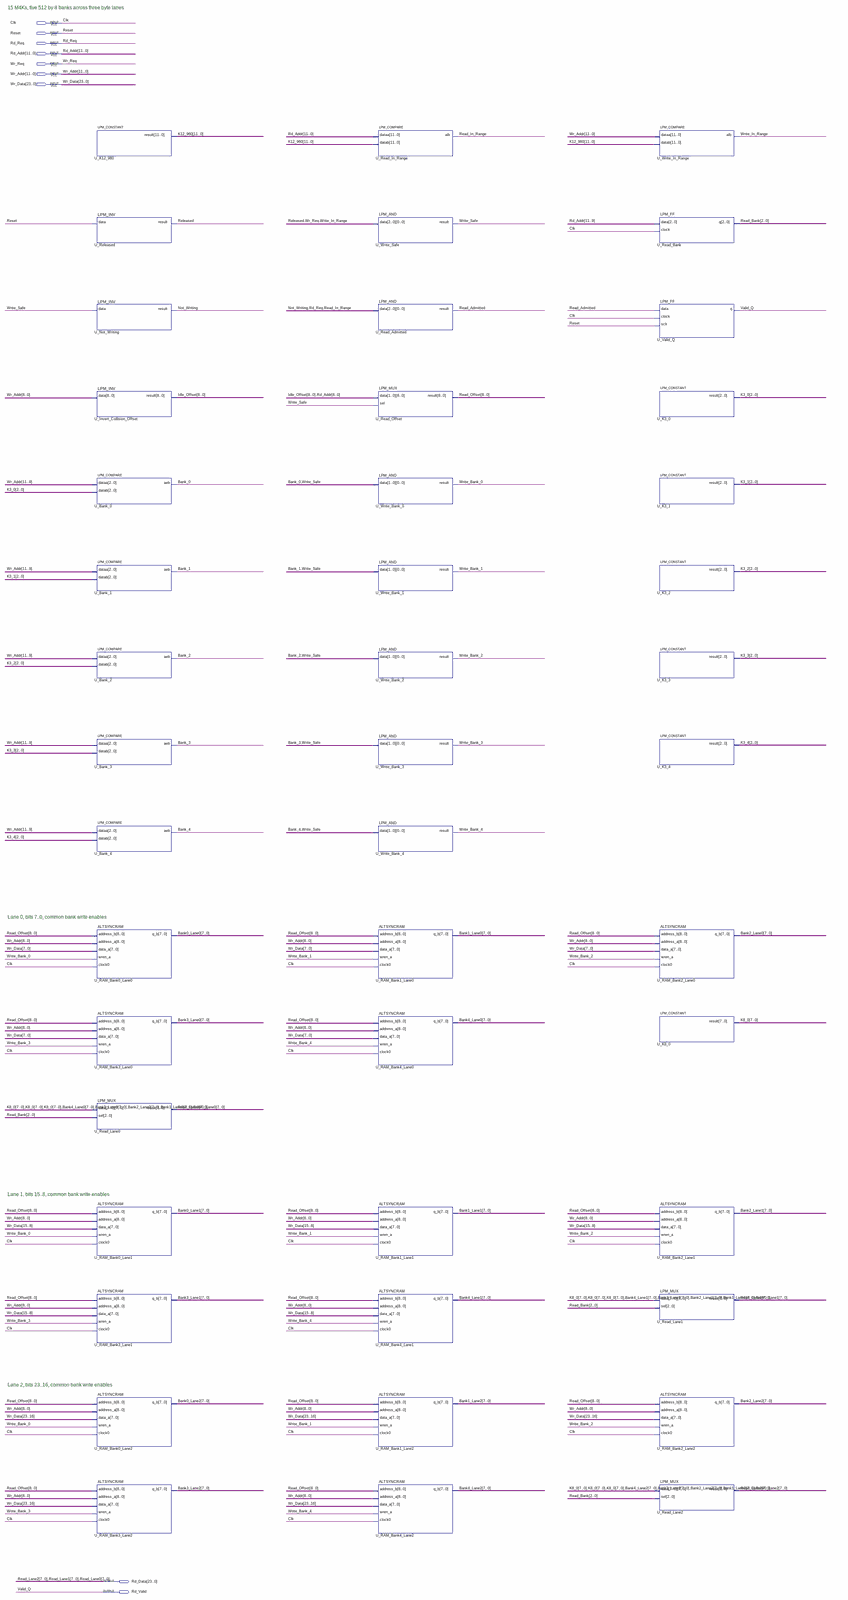
[diagram p0: schematic sheet, whole]
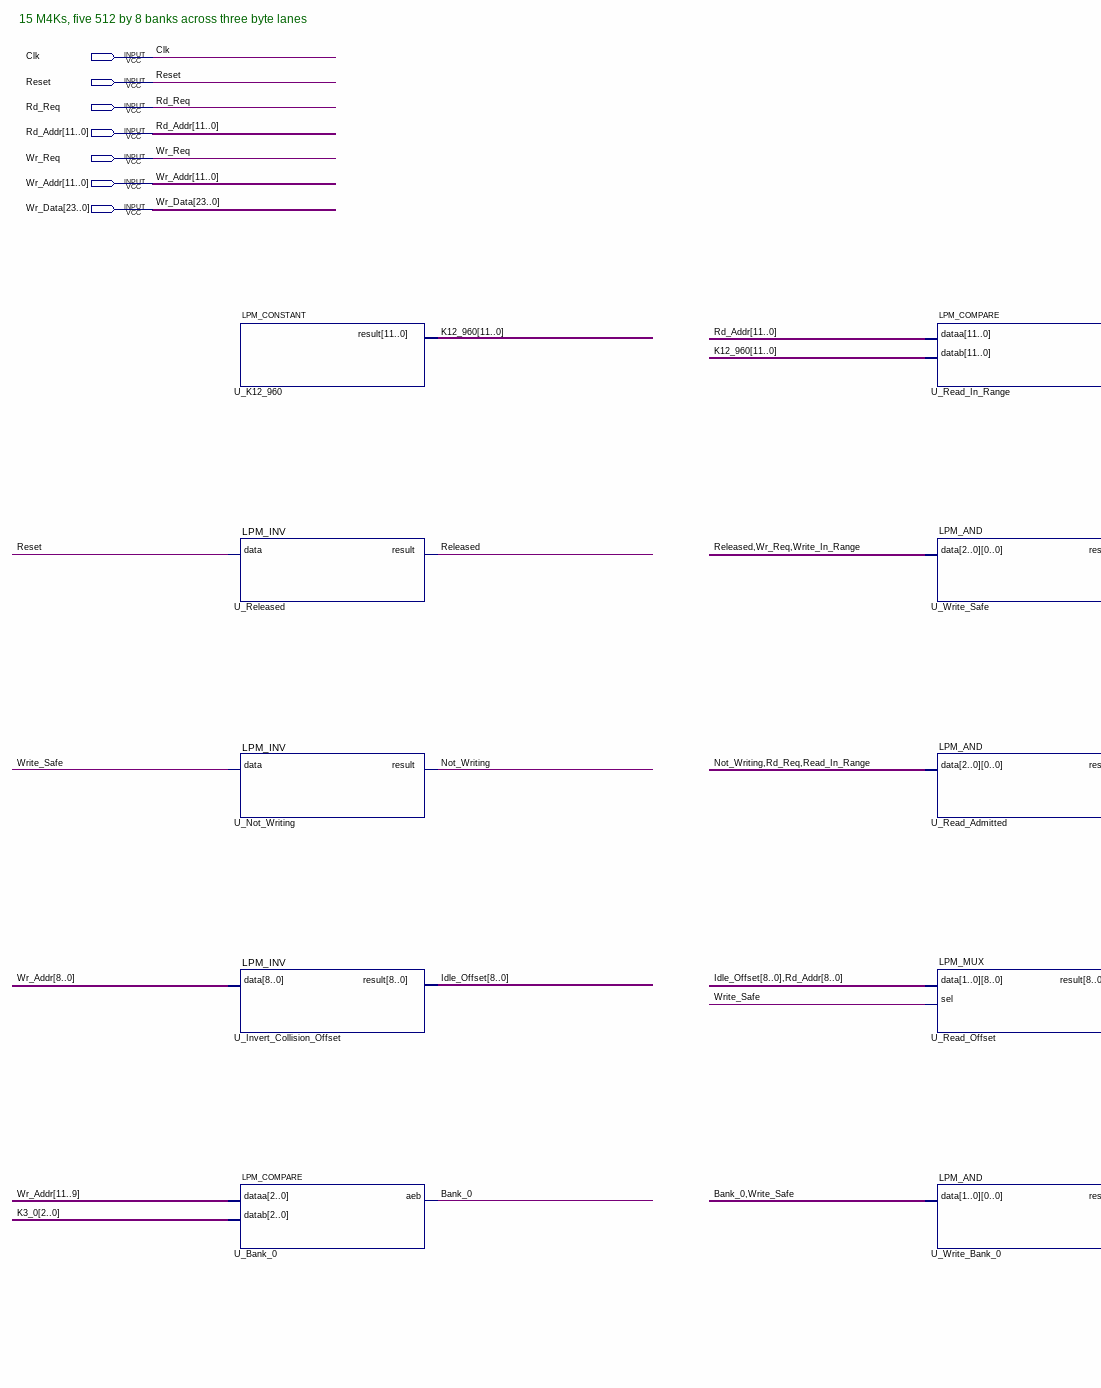
[diagram p1: schematic sheet, upper left part]
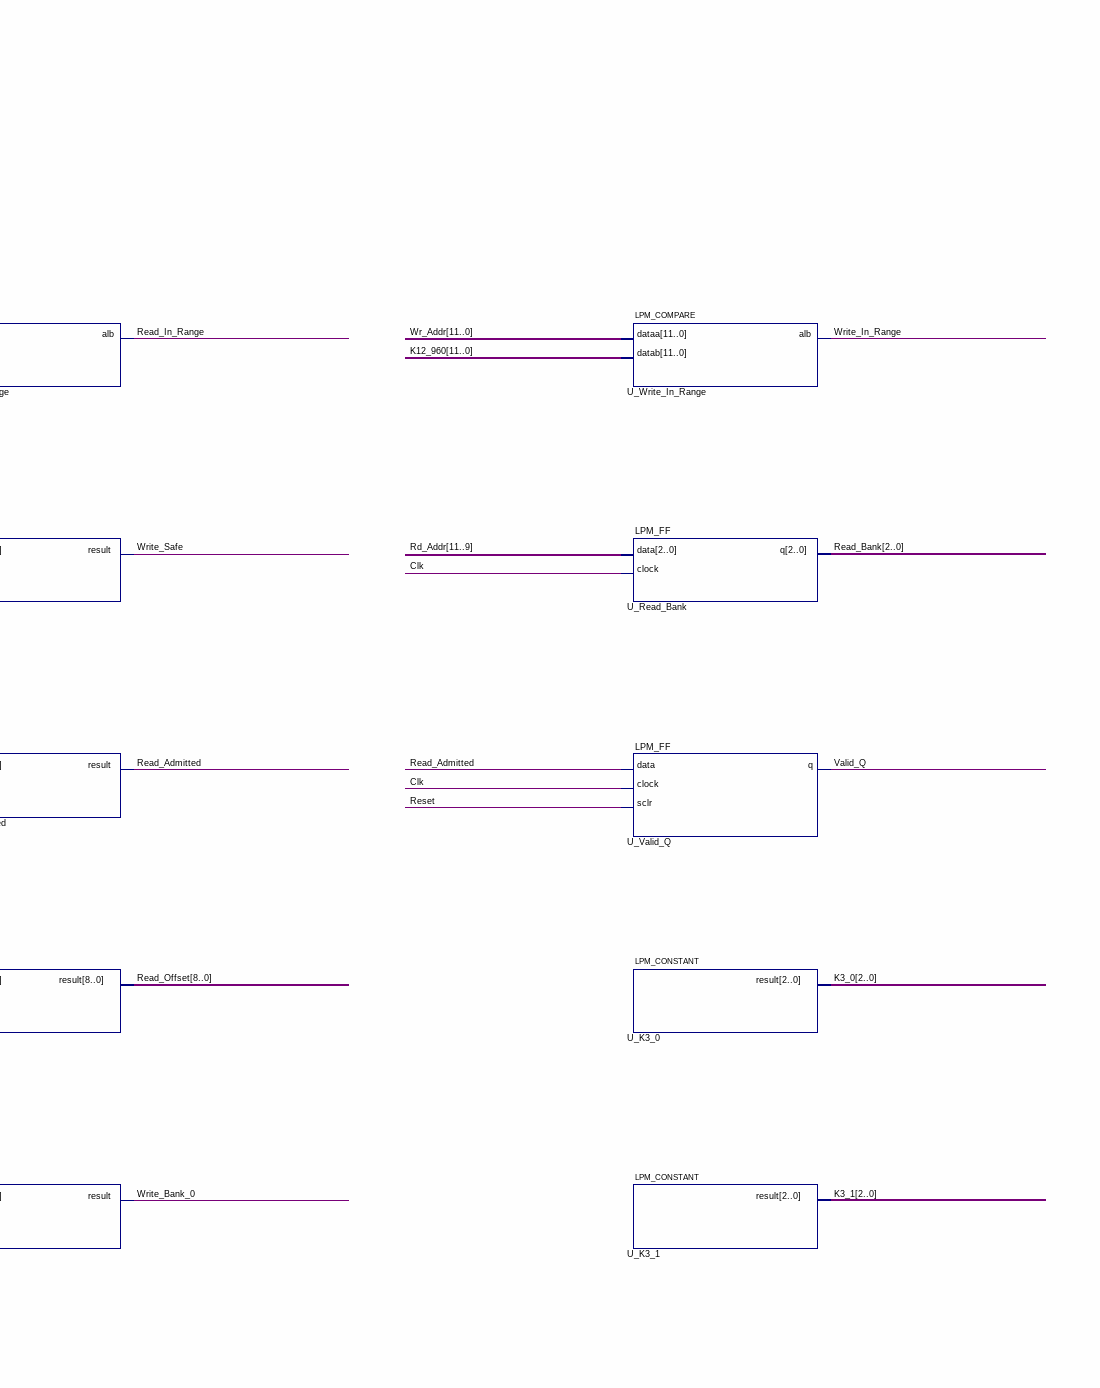
[diagram p2: schematic sheet, upper right part]
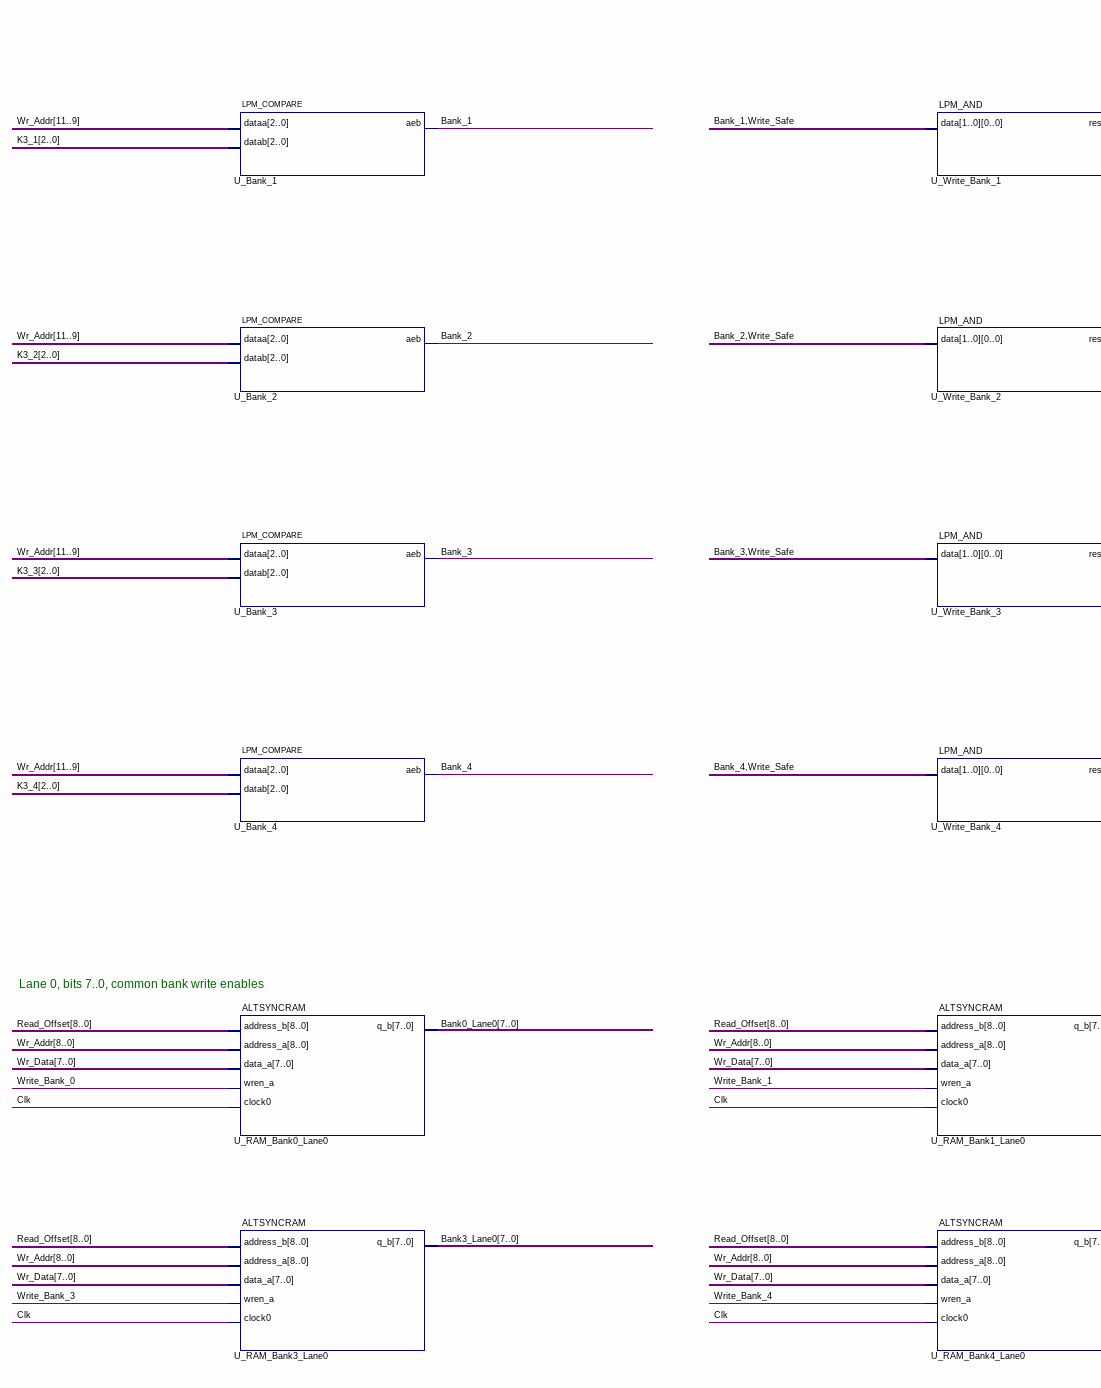
[diagram p3: schematic sheet, middle left part]
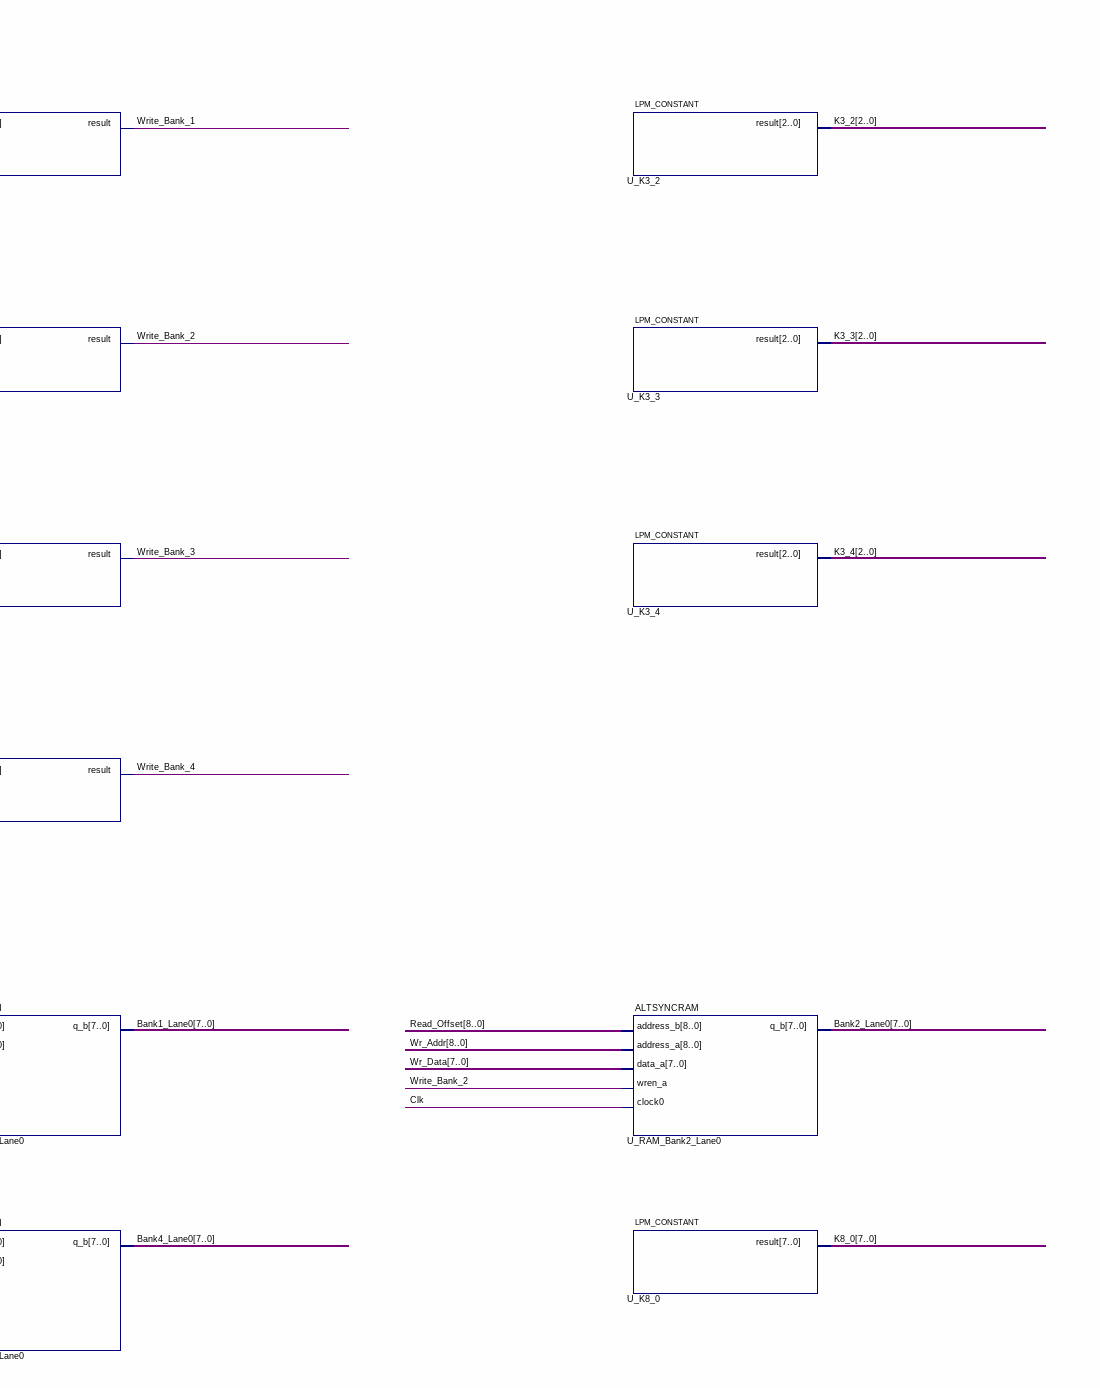
[diagram p4: schematic sheet, middle right part]
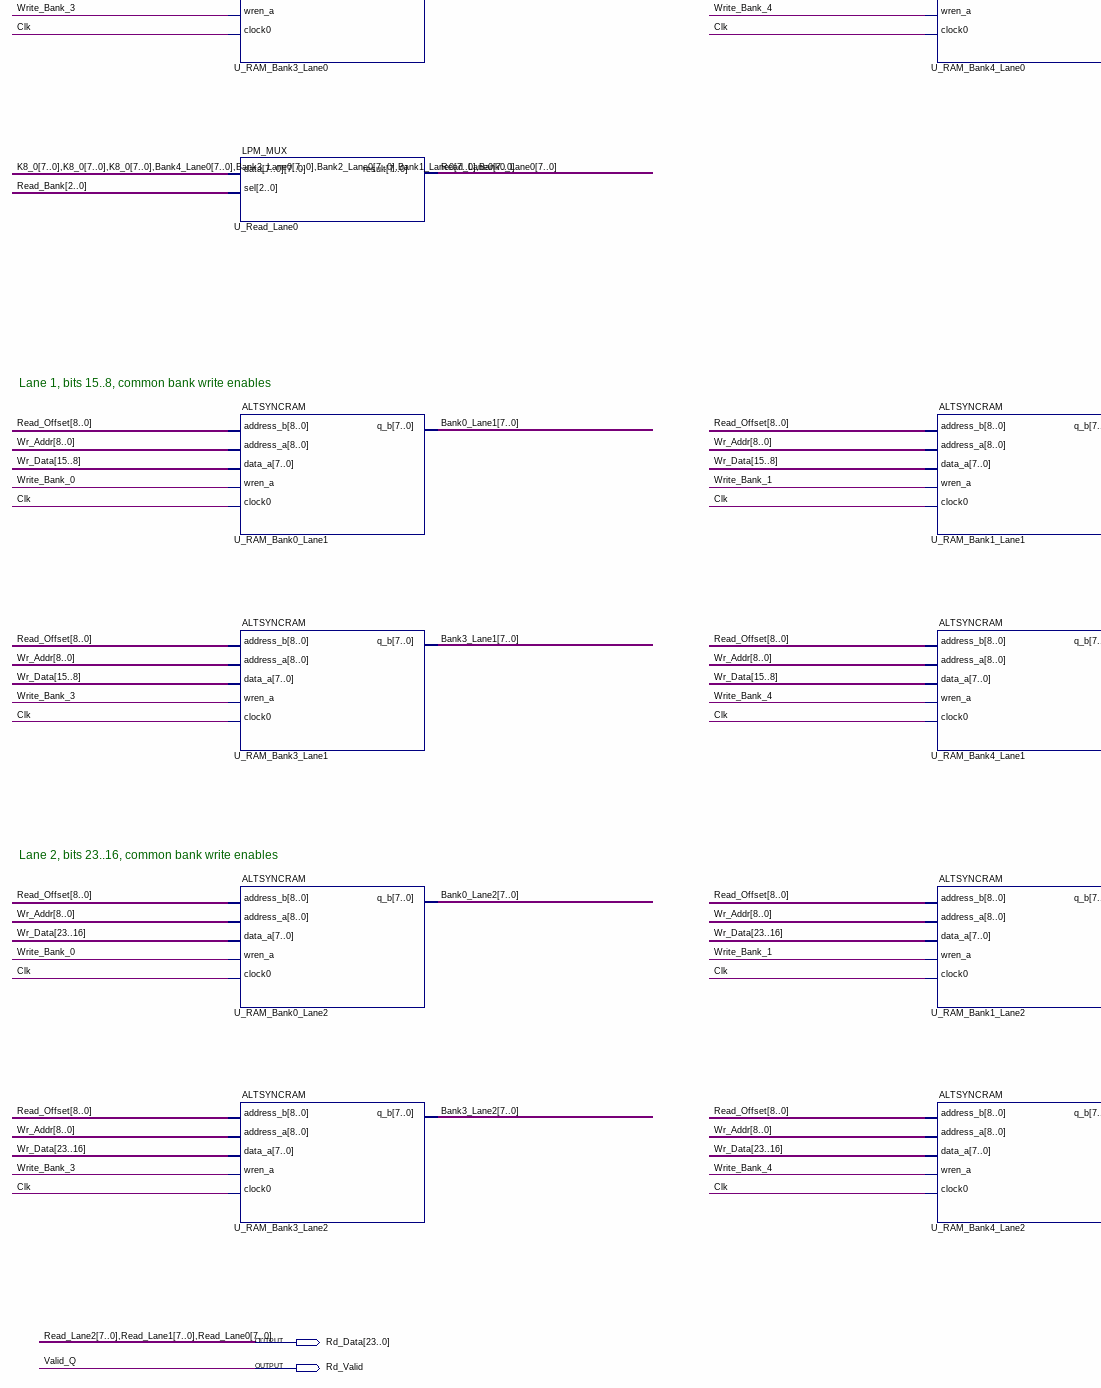
[diagram p5: schematic sheet, lower left part]
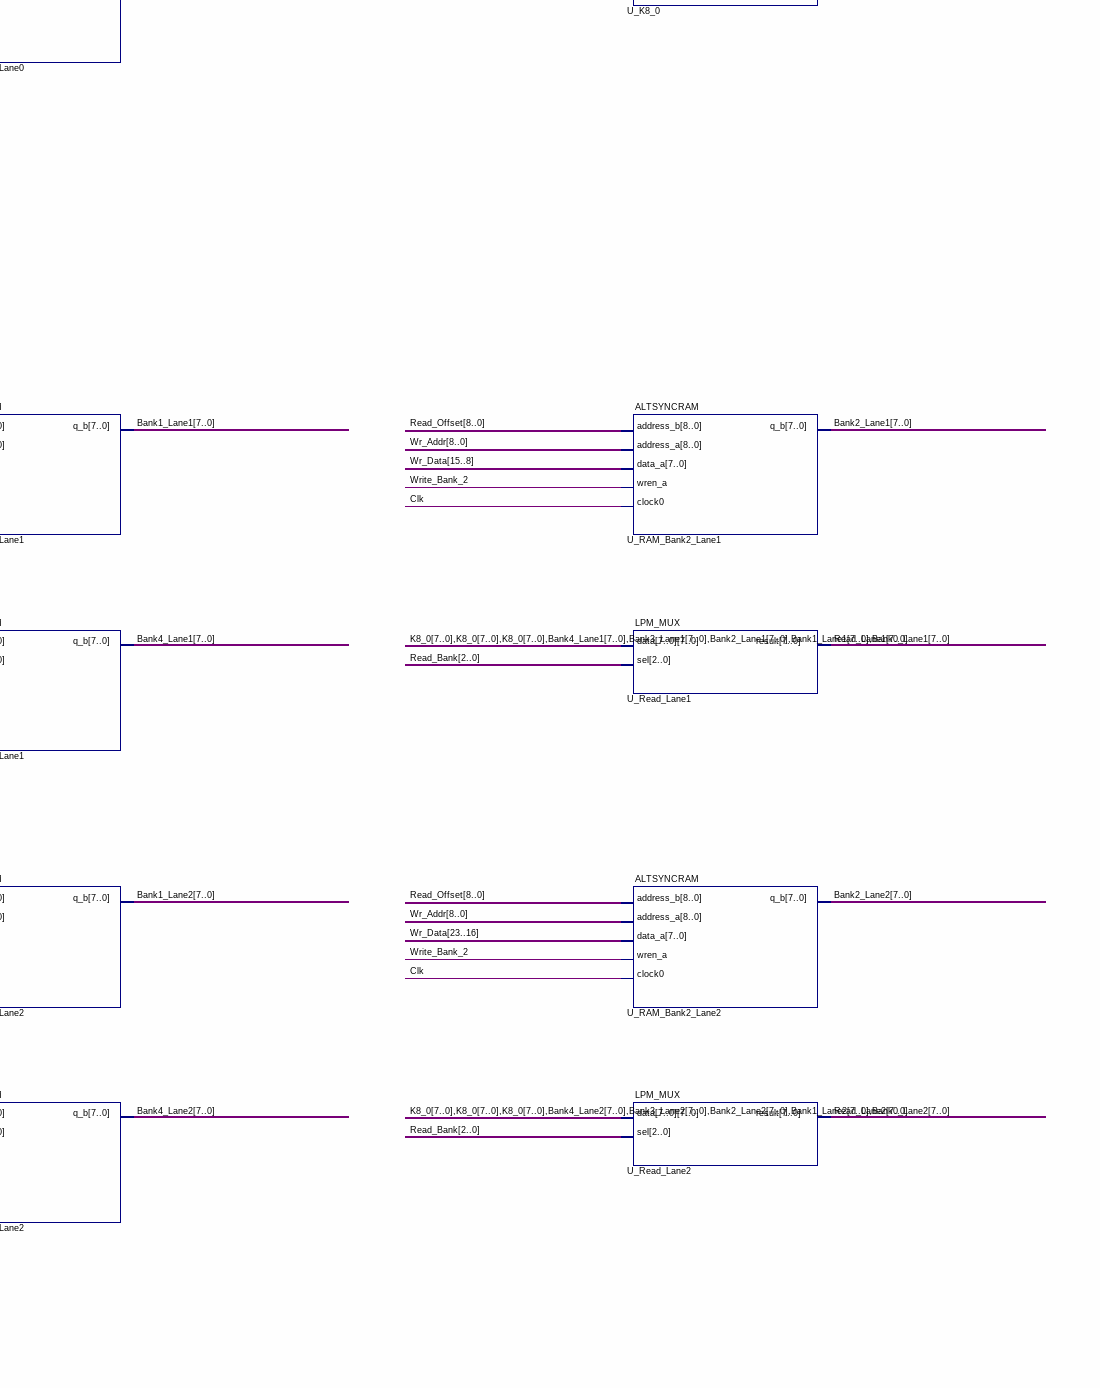
[diagram p6: schematic sheet, lower right part]
// Quartus schematic Screen_Store.bdf as structural Verilog: 45 symbols, 9 pins
module Screen_Store (
  input  Clk,
  input  Reset,
  input  Rd_Req,
  input  [11:0] Rd_Addr,
  input  Wr_Req,
  input  [11:0] Wr_Addr,
  input  [23:0] Wr_Data,
  output [23:0] Rd_Data,
  output Rd_Valid
);

  wire Bank_0, Bank_1, Bank_2, Bank_3, Bank_4, Not_Writing, Read_Admitted, Read_In_Range, Released,
       Write_Bank_0, Write_Bank_1, Write_Bank_2, Write_Bank_3, Write_Bank_4, Write_In_Range, Write_Safe;
  wire [2:0] K3_0, K3_1, K3_2, K3_3, K3_4, Read_Bank;
  wire [7:0] Bank0_Lane0, Bank0_Lane1, Bank0_Lane2, Bank1_Lane0, Bank1_Lane1, Bank1_Lane2, Bank2_Lane0,
       Bank2_Lane1, Bank2_Lane2, Bank3_Lane0, Bank3_Lane1, Bank3_Lane2, Bank4_Lane0, Bank4_Lane1,
       Bank4_Lane2, K8_0;
  wire [8:0] Idle_Offset, Read_Offset;
  wire [11:0] K12_960;

  LPM_CONSTANT #(.LPM_WIDTH(12), .LPM_CVALUE(2400)) U_K12_960 (.result(K12_960));
  LPM_INV #(.LPM_WIDTH(1)) U_Released (.data(Reset), .result(Released));
  LPM_INV #(.LPM_WIDTH(1)) U_Not_Writing (.data(Write_Safe), .result(Not_Writing));
  LPM_INV #(.LPM_WIDTH(9)) U_Invert_Collision_Offset (.data(Wr_Addr[8:0]), .result(Idle_Offset));
  LPM_COMPARE #(.LPM_WIDTH(3), .LPM_REPRESENTATION("UNSIGNED")) U_Bank_0 (
    .dataa(Wr_Addr[11:9]), .datab(K3_0), .aeb(Bank_0));
  LPM_COMPARE #(.LPM_WIDTH(3), .LPM_REPRESENTATION("UNSIGNED")) U_Bank_1 (
    .dataa(Wr_Addr[11:9]), .datab(K3_1), .aeb(Bank_1));
  LPM_COMPARE #(.LPM_WIDTH(3), .LPM_REPRESENTATION("UNSIGNED")) U_Bank_2 (
    .dataa(Wr_Addr[11:9]), .datab(K3_2), .aeb(Bank_2));
  LPM_COMPARE #(.LPM_WIDTH(3), .LPM_REPRESENTATION("UNSIGNED")) U_Bank_3 (
    .dataa(Wr_Addr[11:9]), .datab(K3_3), .aeb(Bank_3));
  LPM_COMPARE #(.LPM_WIDTH(3), .LPM_REPRESENTATION("UNSIGNED")) U_Bank_4 (
    .dataa(Wr_Addr[11:9]), .datab(K3_4), .aeb(Bank_4));
  ALTSYNCRAM #(.OPERATION_MODE("DUAL_PORT"), .RAM_BLOCK_TYPE("M4K"), .WIDTH_A(8), .WIDTH_B(8), .WIDTHAD_A(9), .WIDTHAD_B(9), .NUMWORDS_A(512), .NUMWORDS_B(512), .ADDRESS_REG_B("CLOCK0"), .OUTDATA_REG_B("UNREGISTERED"), .READ_DURING_WRITE_MODE_MIXED_PORTS("DONT_CARE")) U_RAM_Bank0_Lane0 (
    .address_b(Read_Offset), .address_a(Wr_Addr[8:0]), .data_a(Wr_Data[7:0]), .wren_a(Write_Bank_0),
    .clock0(Clk), .q_b(Bank0_Lane0));
  ALTSYNCRAM #(.OPERATION_MODE("DUAL_PORT"), .RAM_BLOCK_TYPE("M4K"), .WIDTH_A(8), .WIDTH_B(8), .WIDTHAD_A(9), .WIDTHAD_B(9), .NUMWORDS_A(512), .NUMWORDS_B(512), .ADDRESS_REG_B("CLOCK0"), .OUTDATA_REG_B("UNREGISTERED"), .READ_DURING_WRITE_MODE_MIXED_PORTS("DONT_CARE")) U_RAM_Bank3_Lane0 (
    .address_b(Read_Offset), .address_a(Wr_Addr[8:0]), .data_a(Wr_Data[7:0]), .wren_a(Write_Bank_3),
    .clock0(Clk), .q_b(Bank3_Lane0));
  LPM_MUX #(.LPM_WIDTH(8), .LPM_SIZE(8), .LPM_WIDTHS(3)) U_Read_Lane0 (
    .data({K8_0, K8_0, K8_0, Bank4_Lane0, Bank3_Lane0, Bank2_Lane0, Bank1_Lane0, Bank0_Lane0}),
    .sel(Read_Bank), .result(Rd_Data[7:0]));
  ALTSYNCRAM #(.OPERATION_MODE("DUAL_PORT"), .RAM_BLOCK_TYPE("M4K"), .WIDTH_A(8), .WIDTH_B(8), .WIDTHAD_A(9), .WIDTHAD_B(9), .NUMWORDS_A(512), .NUMWORDS_B(512), .ADDRESS_REG_B("CLOCK0"), .OUTDATA_REG_B("UNREGISTERED"), .READ_DURING_WRITE_MODE_MIXED_PORTS("DONT_CARE")) U_RAM_Bank0_Lane1 (
    .address_b(Read_Offset), .address_a(Wr_Addr[8:0]), .data_a(Wr_Data[15:8]), .wren_a(Write_Bank_0),
    .clock0(Clk), .q_b(Bank0_Lane1));
  ALTSYNCRAM #(.OPERATION_MODE("DUAL_PORT"), .RAM_BLOCK_TYPE("M4K"), .WIDTH_A(8), .WIDTH_B(8), .WIDTHAD_A(9), .WIDTHAD_B(9), .NUMWORDS_A(512), .NUMWORDS_B(512), .ADDRESS_REG_B("CLOCK0"), .OUTDATA_REG_B("UNREGISTERED"), .READ_DURING_WRITE_MODE_MIXED_PORTS("DONT_CARE")) U_RAM_Bank3_Lane1 (
    .address_b(Read_Offset), .address_a(Wr_Addr[8:0]), .data_a(Wr_Data[15:8]), .wren_a(Write_Bank_3),
    .clock0(Clk), .q_b(Bank3_Lane1));
  ALTSYNCRAM #(.OPERATION_MODE("DUAL_PORT"), .RAM_BLOCK_TYPE("M4K"), .WIDTH_A(8), .WIDTH_B(8), .WIDTHAD_A(9), .WIDTHAD_B(9), .NUMWORDS_A(512), .NUMWORDS_B(512), .ADDRESS_REG_B("CLOCK0"), .OUTDATA_REG_B("UNREGISTERED"), .READ_DURING_WRITE_MODE_MIXED_PORTS("DONT_CARE")) U_RAM_Bank0_Lane2 (
    .address_b(Read_Offset), .address_a(Wr_Addr[8:0]), .data_a(Wr_Data[23:16]), .wren_a(Write_Bank_0),
    .clock0(Clk), .q_b(Bank0_Lane2));
  ALTSYNCRAM #(.OPERATION_MODE("DUAL_PORT"), .RAM_BLOCK_TYPE("M4K"), .WIDTH_A(8), .WIDTH_B(8), .WIDTHAD_A(9), .WIDTHAD_B(9), .NUMWORDS_A(512), .NUMWORDS_B(512), .ADDRESS_REG_B("CLOCK0"), .OUTDATA_REG_B("UNREGISTERED"), .READ_DURING_WRITE_MODE_MIXED_PORTS("DONT_CARE")) U_RAM_Bank3_Lane2 (
    .address_b(Read_Offset), .address_a(Wr_Addr[8:0]), .data_a(Wr_Data[23:16]), .wren_a(Write_Bank_3),
    .clock0(Clk), .q_b(Bank3_Lane2));
  LPM_COMPARE #(.LPM_WIDTH(12), .LPM_REPRESENTATION("UNSIGNED")) U_Read_In_Range (
    .dataa(Rd_Addr), .datab(K12_960), .alb(Read_In_Range));
  LPM_AND #(.LPM_WIDTH(1), .LPM_SIZE(3)) U_Write_Safe (.data({Released, Wr_Req, Write_In_Range}), .result(Write_Safe));
  LPM_AND #(.LPM_WIDTH(1), .LPM_SIZE(3)) U_Read_Admitted (
    .data({Not_Writing, Rd_Req, Read_In_Range}), .result(Read_Admitted));
  LPM_MUX #(.LPM_WIDTH(9), .LPM_SIZE(2), .LPM_WIDTHS(1)) U_Read_Offset (
    .data({Idle_Offset, Rd_Addr[8:0]}), .sel(Write_Safe), .result(Read_Offset));
  LPM_AND #(.LPM_WIDTH(1), .LPM_SIZE(2)) U_Write_Bank_0 (.data({Bank_0, Write_Safe}), .result(Write_Bank_0));
  LPM_AND #(.LPM_WIDTH(1), .LPM_SIZE(2)) U_Write_Bank_1 (.data({Bank_1, Write_Safe}), .result(Write_Bank_1));
  LPM_AND #(.LPM_WIDTH(1), .LPM_SIZE(2)) U_Write_Bank_2 (.data({Bank_2, Write_Safe}), .result(Write_Bank_2));
  LPM_AND #(.LPM_WIDTH(1), .LPM_SIZE(2)) U_Write_Bank_3 (.data({Bank_3, Write_Safe}), .result(Write_Bank_3));
  LPM_AND #(.LPM_WIDTH(1), .LPM_SIZE(2)) U_Write_Bank_4 (.data({Bank_4, Write_Safe}), .result(Write_Bank_4));
  ALTSYNCRAM #(.OPERATION_MODE("DUAL_PORT"), .RAM_BLOCK_TYPE("M4K"), .WIDTH_A(8), .WIDTH_B(8), .WIDTHAD_A(9), .WIDTHAD_B(9), .NUMWORDS_A(512), .NUMWORDS_B(512), .ADDRESS_REG_B("CLOCK0"), .OUTDATA_REG_B("UNREGISTERED"), .READ_DURING_WRITE_MODE_MIXED_PORTS("DONT_CARE")) U_RAM_Bank1_Lane0 (
    .address_b(Read_Offset), .address_a(Wr_Addr[8:0]), .data_a(Wr_Data[7:0]), .wren_a(Write_Bank_1),
    .clock0(Clk), .q_b(Bank1_Lane0));
  ALTSYNCRAM #(.OPERATION_MODE("DUAL_PORT"), .RAM_BLOCK_TYPE("M4K"), .WIDTH_A(8), .WIDTH_B(8), .WIDTHAD_A(9), .WIDTHAD_B(9), .NUMWORDS_A(512), .NUMWORDS_B(512), .ADDRESS_REG_B("CLOCK0"), .OUTDATA_REG_B("UNREGISTERED"), .READ_DURING_WRITE_MODE_MIXED_PORTS("DONT_CARE")) U_RAM_Bank4_Lane0 (
    .address_b(Read_Offset), .address_a(Wr_Addr[8:0]), .data_a(Wr_Data[7:0]), .wren_a(Write_Bank_4),
    .clock0(Clk), .q_b(Bank4_Lane0));
  ALTSYNCRAM #(.OPERATION_MODE("DUAL_PORT"), .RAM_BLOCK_TYPE("M4K"), .WIDTH_A(8), .WIDTH_B(8), .WIDTHAD_A(9), .WIDTHAD_B(9), .NUMWORDS_A(512), .NUMWORDS_B(512), .ADDRESS_REG_B("CLOCK0"), .OUTDATA_REG_B("UNREGISTERED"), .READ_DURING_WRITE_MODE_MIXED_PORTS("DONT_CARE")) U_RAM_Bank1_Lane1 (
    .address_b(Read_Offset), .address_a(Wr_Addr[8:0]), .data_a(Wr_Data[15:8]), .wren_a(Write_Bank_1),
    .clock0(Clk), .q_b(Bank1_Lane1));
  ALTSYNCRAM #(.OPERATION_MODE("DUAL_PORT"), .RAM_BLOCK_TYPE("M4K"), .WIDTH_A(8), .WIDTH_B(8), .WIDTHAD_A(9), .WIDTHAD_B(9), .NUMWORDS_A(512), .NUMWORDS_B(512), .ADDRESS_REG_B("CLOCK0"), .OUTDATA_REG_B("UNREGISTERED"), .READ_DURING_WRITE_MODE_MIXED_PORTS("DONT_CARE")) U_RAM_Bank4_Lane1 (
    .address_b(Read_Offset), .address_a(Wr_Addr[8:0]), .data_a(Wr_Data[15:8]), .wren_a(Write_Bank_4),
    .clock0(Clk), .q_b(Bank4_Lane1));
  ALTSYNCRAM #(.OPERATION_MODE("DUAL_PORT"), .RAM_BLOCK_TYPE("M4K"), .WIDTH_A(8), .WIDTH_B(8), .WIDTHAD_A(9), .WIDTHAD_B(9), .NUMWORDS_A(512), .NUMWORDS_B(512), .ADDRESS_REG_B("CLOCK0"), .OUTDATA_REG_B("UNREGISTERED"), .READ_DURING_WRITE_MODE_MIXED_PORTS("DONT_CARE")) U_RAM_Bank1_Lane2 (
    .address_b(Read_Offset), .address_a(Wr_Addr[8:0]), .data_a(Wr_Data[23:16]), .wren_a(Write_Bank_1),
    .clock0(Clk), .q_b(Bank1_Lane2));
  ALTSYNCRAM #(.OPERATION_MODE("DUAL_PORT"), .RAM_BLOCK_TYPE("M4K"), .WIDTH_A(8), .WIDTH_B(8), .WIDTHAD_A(9), .WIDTHAD_B(9), .NUMWORDS_A(512), .NUMWORDS_B(512), .ADDRESS_REG_B("CLOCK0"), .OUTDATA_REG_B("UNREGISTERED"), .READ_DURING_WRITE_MODE_MIXED_PORTS("DONT_CARE")) U_RAM_Bank4_Lane2 (
    .address_b(Read_Offset), .address_a(Wr_Addr[8:0]), .data_a(Wr_Data[23:16]), .wren_a(Write_Bank_4),
    .clock0(Clk), .q_b(Bank4_Lane2));
  LPM_COMPARE #(.LPM_WIDTH(12), .LPM_REPRESENTATION("UNSIGNED")) U_Write_In_Range (
    .dataa(Wr_Addr), .datab(K12_960), .alb(Write_In_Range));
  LPM_FF #(.LPM_WIDTH(3), .LPM_FFTYPE("DFF")) U_Read_Bank (.data(Rd_Addr[11:9]), .clock(Clk), .q(Read_Bank));
  LPM_FF #(.LPM_WIDTH(1), .LPM_FFTYPE("DFF")) U_Valid_Q (.data(Read_Admitted), .clock(Clk), .sclr(Reset), .q(Rd_Valid));
  LPM_CONSTANT #(.LPM_WIDTH(3), .LPM_CVALUE(0)) U_K3_0 (.result(K3_0));
  LPM_CONSTANT #(.LPM_WIDTH(3), .LPM_CVALUE(1)) U_K3_1 (.result(K3_1));
  LPM_CONSTANT #(.LPM_WIDTH(3), .LPM_CVALUE(2)) U_K3_2 (.result(K3_2));
  LPM_CONSTANT #(.LPM_WIDTH(3), .LPM_CVALUE(3)) U_K3_3 (.result(K3_3));
  LPM_CONSTANT #(.LPM_WIDTH(3), .LPM_CVALUE(4)) U_K3_4 (.result(K3_4));
  ALTSYNCRAM #(.OPERATION_MODE("DUAL_PORT"), .RAM_BLOCK_TYPE("M4K"), .WIDTH_A(8), .WIDTH_B(8), .WIDTHAD_A(9), .WIDTHAD_B(9), .NUMWORDS_A(512), .NUMWORDS_B(512), .ADDRESS_REG_B("CLOCK0"), .OUTDATA_REG_B("UNREGISTERED"), .READ_DURING_WRITE_MODE_MIXED_PORTS("DONT_CARE")) U_RAM_Bank2_Lane0 (
    .address_b(Read_Offset), .address_a(Wr_Addr[8:0]), .data_a(Wr_Data[7:0]), .wren_a(Write_Bank_2),
    .clock0(Clk), .q_b(Bank2_Lane0));
  LPM_CONSTANT #(.LPM_WIDTH(8), .LPM_CVALUE(0)) U_K8_0 (.result(K8_0));
  ALTSYNCRAM #(.OPERATION_MODE("DUAL_PORT"), .RAM_BLOCK_TYPE("M4K"), .WIDTH_A(8), .WIDTH_B(8), .WIDTHAD_A(9), .WIDTHAD_B(9), .NUMWORDS_A(512), .NUMWORDS_B(512), .ADDRESS_REG_B("CLOCK0"), .OUTDATA_REG_B("UNREGISTERED"), .READ_DURING_WRITE_MODE_MIXED_PORTS("DONT_CARE")) U_RAM_Bank2_Lane1 (
    .address_b(Read_Offset), .address_a(Wr_Addr[8:0]), .data_a(Wr_Data[15:8]), .wren_a(Write_Bank_2),
    .clock0(Clk), .q_b(Bank2_Lane1));
  LPM_MUX #(.LPM_WIDTH(8), .LPM_SIZE(8), .LPM_WIDTHS(3)) U_Read_Lane1 (
    .data({K8_0, K8_0, K8_0, Bank4_Lane1, Bank3_Lane1, Bank2_Lane1, Bank1_Lane1, Bank0_Lane1}),
    .sel(Read_Bank), .result(Rd_Data[15:8]));
  ALTSYNCRAM #(.OPERATION_MODE("DUAL_PORT"), .RAM_BLOCK_TYPE("M4K"), .WIDTH_A(8), .WIDTH_B(8), .WIDTHAD_A(9), .WIDTHAD_B(9), .NUMWORDS_A(512), .NUMWORDS_B(512), .ADDRESS_REG_B("CLOCK0"), .OUTDATA_REG_B("UNREGISTERED"), .READ_DURING_WRITE_MODE_MIXED_PORTS("DONT_CARE")) U_RAM_Bank2_Lane2 (
    .address_b(Read_Offset), .address_a(Wr_Addr[8:0]), .data_a(Wr_Data[23:16]), .wren_a(Write_Bank_2),
    .clock0(Clk), .q_b(Bank2_Lane2));
  LPM_MUX #(.LPM_WIDTH(8), .LPM_SIZE(8), .LPM_WIDTHS(3)) U_Read_Lane2 (
    .data({K8_0, K8_0, K8_0, Bank4_Lane2, Bank3_Lane2, Bank2_Lane2, Bank1_Lane2, Bank0_Lane2}),
    .sel(Read_Bank), .result(Rd_Data[23:16]));

  // Other names for the same wires on the sheet: Read_Lane0[7:0] = Rd_Data[7:0]; Read_Lane1[7:0] = Rd_Data[15:8];
  //   Read_Lane2[7:0] = Rd_Data[23:16]; Valid_Q = Rd_Valid

  // Notes on the sheet:
  //   15 M4Ks, five 512 by 8 banks across three byte lanes
  //   Lane 0, bits 7..0, common bank write enables
  //   Lane 1, bits 15..8, common bank write enables
  //   Lane 2, bits 23..16, common bank write enables
endmodule
